# Altium schematic sheet Main.SchDoc
size A3; ApprovedBy: Franci Lahajnar; CheckedBy: Franci Lahajnar; Author: Ciril Močnik; DrawnBy: Ciril Močnik; Engineer: Franci Lahajnar; DocumentNumber: 1; SheetNumber: 1; SheetTotal: 12; PageSetup: Record=PageOptions|CenterHorizontal=True|CenterVertical=True|PrintScale=0.96|XCorrection=1.00|YCorrection=1.00|PrintKind=0|BorderSize=5000000|LeftOffset=0|BottomOffset=0|Orientation=2|PaperLength=1000|PaperWidth=1000|Scale=100|PaperSource=7|PrintQuality=600|MediaType=1|DitherType=10|PrintScaleMode=1|PaperKind=A4 210 x 297 mm; Sklop: SCHEMATIC; TipDok: SCHEMATIC; ModifiedDate: 2.10.2018
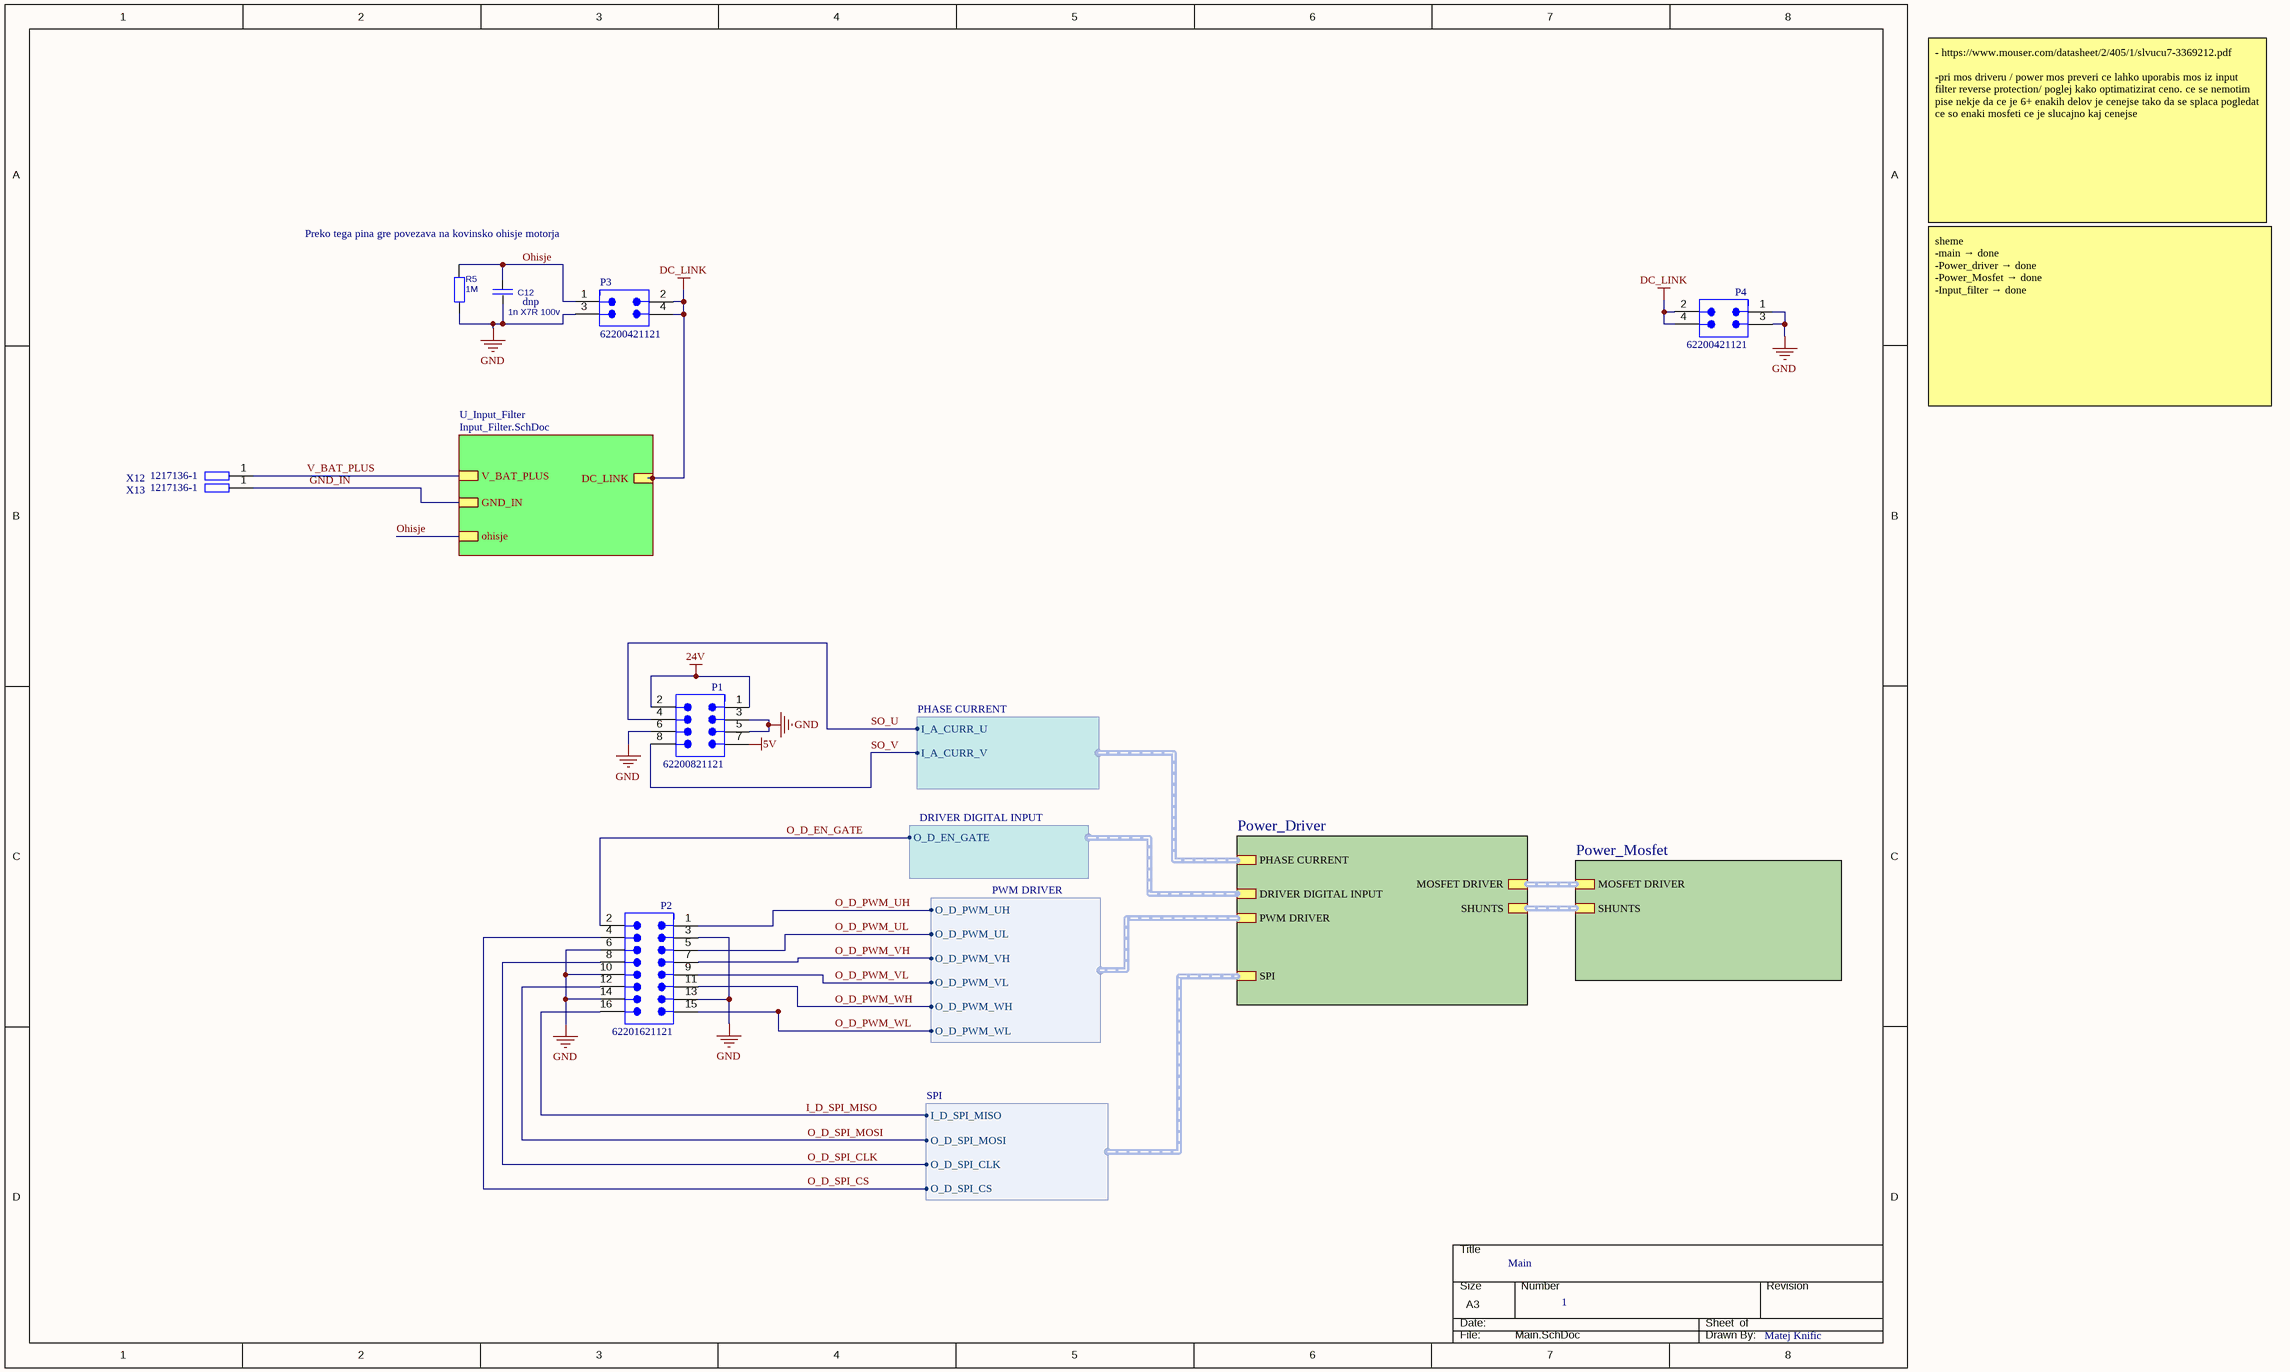
[diagram p0: Main.SchDoc]

## Parts
C12  Parameter 1: dnp  [C0603]  (hidden comment: 1n X7R 100v)
P1  62200821121  [62200821121]
P2  62201621121  [62201621121]
P3  62200421121  [62200421121]
P4  62200421121  [62200421121]
R5  1M  [R0603]
X12  Manufacturer code: 1217136-1  [FPR_TAB_6.3_P5.08_Pokončni]  (hidden comment: C_TE_FASTON_6.3_P5.08)
X13  Manufacturer code: 1217136-1  [FPR_TAB_6.3_P5.08_Pokončni]  (hidden comment: C_TE_FASTON_6.3_P5.08)

## Sub-sheets
Power_Driver = Power_Driver.SchDoc: MOSFET DRIVER (harness MOSFET DRIVER), DRIVER DIGITAL INPUT (harness DRIVER DIGITAL INPUT), SPI (harness SPI), PHASE CURRENT (harness PHASE CURRENT), SHUNTS (harness SHUNTS), PWM DRIVER (harness PWM DRIVER)
Power_Mosfet = Power_Mosfet.SchDoc: MOSFET DRIVER (harness MOSFET DRIVER), SHUNTS (harness Shunts)
U_Input_Filter = Input_Filter.SchDoc: V_BAT_PLUS, DC_LINK, GND_IN, ohisje

## Harnesses
SPI: I_D_SPI_MISO, O_D_SPI_CLK, O_D_SPI_CS, O_D_SPI_MOSI
PWM DRIVER: O_D_PWM_UH, O_D_PWM_UL, O_D_PWM_VH, O_D_PWM_VL, O_D_PWM_WH, O_D_PWM_WL
DRIVER DIGITAL INPUT: O_D_EN_GATE
PHASE CURRENT: I_A_CURR_U, I_A_CURR_V

## Nets
5V: P1.7
24V: P1.1 P1.2
DC_LINK: P3.2 P3.4 P4.2 P4.4 ; sheet U_Input_Filter/DC_LINK
GND: C12.2 P1.3 P1.5 P1.6 P2.3 P2.6 P2.10 P2.13 P2.14 P3.3 P4.1 P4.3 R5.1
GND_IN: X13.1 ; sheet U_Input_Filter/GND_IN
I_D_SPI_MISO: P2.16 ; sheet Power_Driver/SPI.I_D_SPI_MISO
O_D_EN_GATE: P2.2 ; sheet Power_Driver/DRIVER DIGITAL INPUT.O_D_EN_GATE
O_D_PWM_UH: P2.1 ; sheet Power_Driver/PWM DRIVER.O_D_PWM_UH
O_D_PWM_UL: P2.5 ; sheet Power_Driver/PWM DRIVER.O_D_PWM_UL
O_D_PWM_VH: P2.7 ; sheet Power_Driver/PWM DRIVER.O_D_PWM_VH
O_D_PWM_VL: P2.9 ; sheet Power_Driver/PWM DRIVER.O_D_PWM_VL
O_D_PWM_WH: P2.11 ; sheet Power_Driver/PWM DRIVER.O_D_PWM_WH
O_D_PWM_WL: P2.15 ; sheet Power_Driver/PWM DRIVER.O_D_PWM_WL
O_D_SPI_CLK: P2.8 ; sheet Power_Driver/SPI.O_D_SPI_CLK
O_D_SPI_CS: P2.4 ; sheet Power_Driver/SPI.O_D_SPI_CS
O_D_SPI_MOSI: P2.12 ; sheet Power_Driver/SPI.O_D_SPI_MOSI
Ohisje: C12.1 P3.1 R5.2 ; sheet U_Input_Filter/ohisje
SO_U: P1.4 ; sheet Power_Driver/PHASE CURRENT.I_A_CURR_U
SO_V: P1.8 ; sheet Power_Driver/PHASE CURRENT.I_A_CURR_V
V_BAT_PLUS: X12.1 ; sheet U_Input_Filter/V_BAT_PLUS

## Buses and harness runs
harness sheet Power_Driver/MOSFET DRIVER = sheet Power_Mosfet/MOSFET DRIVER
harness sheet Power_Driver/SHUNTS = sheet Power_Mosfet/SHUNTS

## Notes on the sheet
- - https://www.mouser.com/datasheet/2/405/1/slvucu7-3369212.pdf
  -pri mos driveru / power mos preveri ce lahko uporabis mos iz input filter reverse protection/ poglej kako optimatizirat ceno. ce se nemotim pise nekje da ce je 6+ enakih delov je cenejse tako da se splaca pogledat ce so enaki mosfeti ce je slucajno kaj cenejse
- Preko tega pina gre povezava na kovinsko ohisje motorja
- sheme
  -main → done
  -Power_driver → done
  -Power_Mosfet → done
  -Input_filter → done
- Main
- Matej Knific
- THIS DOCUMENT AND THE DATA DISCLOSED HEREIN OR
- HEREWITH IS THE PROPERTY OF ALTIUM LIMITED AND MAY
- DWG NO:
- REVISION
- REV:
- DESCRIPTION
- DATE
- APPROVED
- BE FREELY DISTRIBUTED IN WHOLE. NO RIGHTS ARE
- RESERVED OR EXPRESS OR IMPLIED WARANTEE GIVEN.
- ENG:
- APPROVALS
- PROJECT
- DSN:
- CHK:
- REFERENCE DOCUMENTS
- PROJECT REVISION:
- TITLE
- DOCUMENT REVISION:
- DESIGN ITEM:
- BOM:
- FAB DWG:
- PCB DWG:
- ASSY DWG:
- SCALE:
- A3
- SIZE
- CAGE CODE
- FILE NAME
- DWG NO.
- SHEET
- OF
- REV

## Library data of the parts
C12 = C: Capacitor; Value: 1n X7R 100v
P1 = CMP-1502-00947-4: THT Vertical Pin Header WR-PHD, Pitch 1.27 mm, Dual Row, 8 pins; System: Connector; Row Spacing: 1.27mm; Connector Type: Male Pin; Contact Resistance: 20mΩ; Number of Contacts: 8; Current Rating: 1A; Gender: Male; Contact Plating: Gold; Packaging: Box; Termination: Solder; Number of Pins: 8; Lead Pitch: 1.27mm; Contact Material: Copper; Pitch: 1.27mm; Contact Mating Length: 3.81mm; Number of Rows: 2; RoHS: Compliant; Orientation: Vertical; Color: Black; Mount: Through Hole; Number of Positions: 8
P2 = CMP-1502-00950-4: THT Vertical Pin Header WR-PHD, Pitch 1.27 mm, Dual Row, 16 pins; Number of Positions: 16; Pitch: 1.27mm; Connector Type: Male Pin; Gender: Male; Current Rating: 1A; Contact Resistance: 20mΩ; System: Connector; RoHS: Compliant; Number of Rows: 2; Lead Pitch: 1.27mm; Contact Mating Length: 3.81mm; Row Spacing: 1.27mm; Mount: Through Hole; Number of Contacts: 16; Color: Black; Contact Material: Copper; Termination: Solder; Number of Pins: 16; Orientation: Vertical; Packaging: Box; Contact Plating: Gold
P3 P4 = CMP-1502-00946-4: THT Vertical Pin Header WR-PHD, Pitch 1.27 mm, Dual Row, 4 pins; Row Spacing: 1.27mm; Gender: Male; Number of Positions: 4; Contact Resistance: 20mΩ; Current Rating: 1A; System: Connector; Connector Type: Male Pin; Pitch: 1.27mm; Termination: Solder; Packaging: Box; Contact Mating Length: 3.81mm; Number of Pins: 4; Color: Black; Number of Contacts: 4; Contact Material: Copper; Orientation: Vertical; RoHS: Compliant; Mount: Through Hole; Lead Pitch: 1.27mm; Contact Plating: Gold; Number of Rows: 2
R5 = R: Value: 1M
X12 X13 = C_TE_FASTON_6.3_P5.08-4: FASTON 6.3 P5.08 Pokončni; Manufacturer: TE CONNECTIVITY; Voltage: /; SAP Ident: 1163972; SAP Name: KONEKTOR 1217136-1 TEC; BS: BS1552; AEC: No; Class: 15526; PinCount: 1; Datasheet: -; ROHS: 2011/65/EU; Mount: THT; REACH: 21.1.2025; TemperatureGrade: -30...110 °C; Current: -; HRVal: 1217136-1; Housing: 6.3x0.8mm; UL: /; MSL: 1